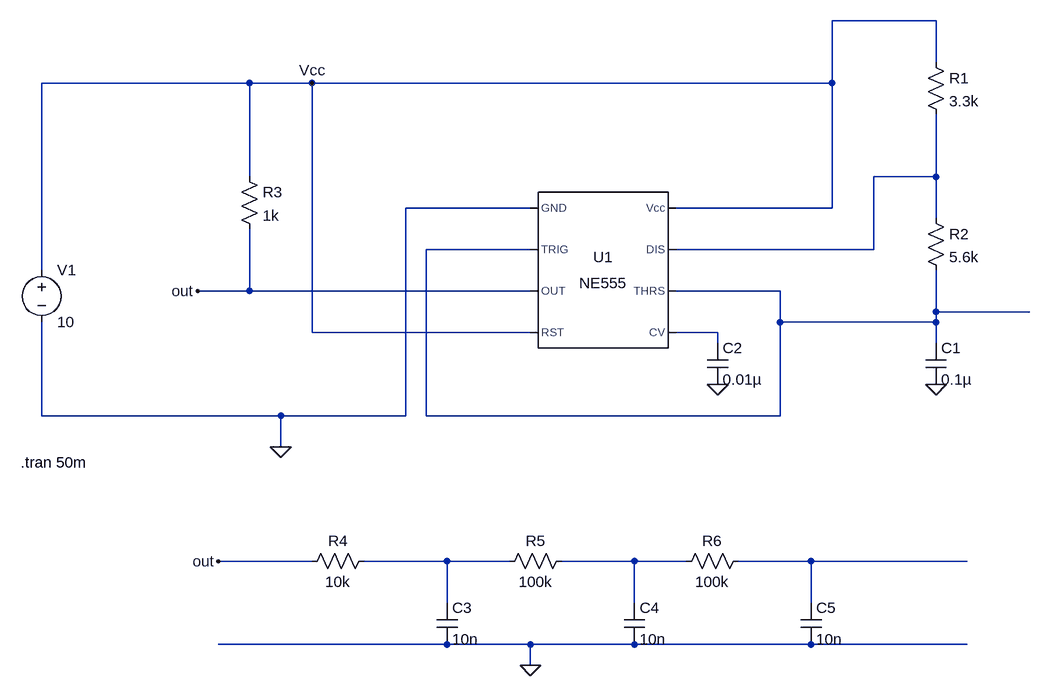
[diagram p0: schematic Astable Multiviberator.asc]
Astable Multiviberator.asc, the LTspice schematic file:
Version 4.1
SHEET 1 1032 804
WIRE 736 -208 576 -208
WIRE 736 -144 736 -208
WIRE -320 -112 -640 -112
WIRE -224 -112 -320 -112
WIRE 576 -112 576 -208
WIRE 576 -112 -224 -112
WIRE -320 32 -320 -112
WIRE 736 32 736 -64
WIRE 736 32 640 32
WIRE 112 80 -80 80
WIRE 576 80 576 -112
WIRE 576 80 336 80
WIRE 736 96 736 32
WIRE 112 144 -48 144
WIRE 640 144 640 32
WIRE 640 144 336 144
WIRE -640 176 -640 -112
WIRE -320 208 -320 112
WIRE -320 208 -400 208
WIRE 112 208 -320 208
WIRE 496 208 336 208
WIRE 736 240 736 176
WIRE 880 240 736 240
WIRE 496 256 496 208
WIRE 736 256 736 240
WIRE 736 256 496 256
WIRE -224 272 -224 -112
WIRE 112 272 -224 272
WIRE 400 272 336 272
WIRE 400 288 400 272
WIRE 736 288 736 256
WIRE -640 400 -640 256
WIRE -272 400 -640 400
WIRE -80 400 -80 80
WIRE -80 400 -272 400
WIRE -48 400 -48 144
WIRE 496 400 496 256
WIRE 496 400 -48 400
WIRE -272 448 -272 400
WIRE -224 624 -368 624
WIRE -16 624 -144 624
WIRE 80 624 -16 624
WIRE 272 624 160 624
WIRE 352 624 272 624
WIRE 544 624 432 624
WIRE 784 624 544 624
WIRE -16 688 -16 624
WIRE 272 688 272 624
WIRE 544 688 544 624
WIRE -16 752 -368 752
WIRE 112 752 -16 752
WIRE 272 752 112 752
WIRE 544 752 272 752
WIRE 784 752 544 752
WIRE 112 784 112 752
FLAG -272 448 0
FLAG 736 352 0
FLAG -400 208 out
FLAG -224 -112 Vcc
FLAG 400 352 0
FLAG -368 624 out
FLAG 112 784 0
SYMBOL Misc\\NE555 224 176 R0
SYMATTR InstName U1
SYMBOL voltage -640 160 R0
WINDOW 123 0 0 Left 0
WINDOW 39 0 0 Left 0
SYMATTR InstName V1
SYMATTR Value 10
SYMBOL res 720 -160 R0
SYMATTR InstName R1
SYMATTR Value 3.3k
SYMBOL res 720 80 R0
SYMATTR InstName R2
SYMATTR Value 5.6k
SYMBOL cap 720 288 R0
SYMATTR InstName C1
SYMATTR Value 0.1µ
SYMBOL res -336 16 R0
SYMATTR InstName R3
SYMATTR Value 1k
SYMBOL cap 384 288 R0
SYMATTR InstName C2
SYMATTR Value 0.01µ
SYMBOL res -128 608 R90
WINDOW 0 0 56 VBottom 2
WINDOW 3 32 56 VTop 2
SYMATTR InstName R4
SYMATTR Value 10k
SYMBOL cap -32 688 R0
SYMATTR InstName C3
SYMATTR Value 10n
SYMBOL cap 256 688 R0
SYMATTR InstName C4
SYMATTR Value 10n
SYMBOL cap 528 688 R0
SYMATTR InstName C5
SYMATTR Value 10n
SYMBOL res 176 608 R90
WINDOW 0 0 56 VBottom 2
WINDOW 3 32 56 VTop 2
SYMATTR InstName R5
SYMATTR Value 100k
SYMBOL res 448 608 R90
WINDOW 0 0 56 VBottom 2
WINDOW 3 32 56 VTop 2
SYMATTR InstName R6
SYMATTR Value 100k
TEXT -672 472 Left 2 !.tran 50m

The netlist it stands for:
* Astable Multiviberator.asc
X§U1 0 N002 out Vcc N003 N002 N001 Vcc NE555  ; pins GND TRIG OUT RST CV THRS DIS Vcc
V1 Vcc 0 10
R1 Vcc N001 3.3k
R2 N001 N002 5.6k
C1 N002 0 0.1µ
R3 Vcc out 1k
C2 N003 0 0.01µ
R4 N004 out 10k
C3 N004 0 10n
C4 N005 0 10n
C5 N006 0 10n
R5 N005 N004 100k
R6 N006 N005 100k
.tran 50m
.lib NE555.sub
.backanno
.end